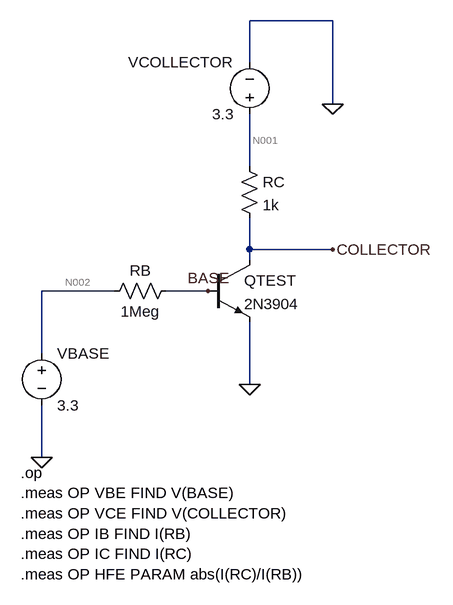
[diagram p0: schematic BJT_NPN_Active_Test.asc]
BJT_NPN_Active_Test.asc, the LTspice schematic file:
Version 4
SHEET 1 880 728
WIRE 288 16 160 16
WIRE 160 80 160 16
WIRE 288 144 288 16
WIRE 160 240 160 160
WIRE 160 368 160 320
WIRE 288 368 160 368
WIRE 160 384 160 368
WIRE -48 432 -160 432
WIRE 96 432 32 432
WIRE -160 528 -160 432
WIRE 160 576 160 480
WIRE -160 688 -160 608
FLAG 160 576 0
FLAG -160 688 0
FLAG 288 144 0
FLAG 288 368 COLLECTOR
FLAG 96 432 BASE
SYMBOL voltage 160 176 R180
WINDOW 0 24 96 Left 2
WINDOW 3 24 16 Left 2
WINDOW 123 0 0 Left 0
WINDOW 39 0 0 Left 0
SYMATTR InstName VCOLLECTOR
SYMATTR Value 3.3
SYMBOL res 144 224 R0
SYMATTR InstName RC
SYMATTR Value 1k
SYMBOL npn 96 384 R0
SYMATTR InstName QTEST
SYMATTR Value 2N3904
SYMBOL voltage -160 512 R0
WINDOW 123 0 0 Left 0
WINDOW 39 0 0 Left 0
SYMATTR InstName VBASE
SYMATTR Value 3.3
SYMBOL res 48 416 R90
WINDOW 0 0 56 VBottom 2
WINDOW 3 32 56 VTop 2
SYMATTR InstName RB
SYMATTR Value 1Meg
TEXT -192 712 Left 2 !.op\n.meas OP VBE FIND V(BASE)\n.meas OP VCE FIND V(COLLECTOR)\n.meas OP IB FIND I(RB)\n.meas OP IC FIND I(RC)\n.meas OP HFE PARAM abs(I(RC)/I(RB))

The netlist it stands for:
* BJT_NPN_Active_Test.asc
VCOLLECTOR N001 0 3.3
RC N001 COLLECTOR 1k
QTEST COLLECTOR BASE 0 0 2N3904
VBASE N002 0 3.3
RB BASE N002 1Meg
.model NPN NPN
.model PNP PNP
.lib standard.bjt
.op
.meas OP VBE FIND V(BASE)
.meas OP VCE FIND V(COLLECTOR)
.meas OP IB FIND I(RB)
.meas OP IC FIND I(RC)
.meas OP HFE PARAM abs(I(RC)/I(RB))
.backanno
.end

* Results of the author's LTspice run, read from the files saved beside the schematic
* Operating Point:
*   V(base) = 649.3 mV
*   V(collector) = 2.492 V
*   V(n001) = 3.3 V
*   V(n002) = 3.3 V
*   I(RB) = -2.651 µA
*   I(RC) = 808.2 µA
*   I(VBASE) = -2.651 µA
*   I(VCOLLECTOR) = -808.2 µA
*   Ib(QTEST) = 2.651 µA
*   Ic(QTEST) = 808.2 µA
*   Ie(QTEST) = -810.9 µA
*   Is(QTEST) = 0 A
* From the log:
*   vbe: V(BASE)=0.649325739902 at 0.649325739902
*   vce: V(COLLECTOR)=2.49175024033 at 0.649325739902
*   ib: I(RB)=-2.65067433247e-06 at 0.649325739902
*   ic: I(RC)=0.000808249809779 at 0.649325739902
*   hfe: abs(I(RC)/I(RB))=304.922336131